# Altium schematic sheet Power Distribution Block.SchDoc: Power Distribution Board
size A4; DocumentNumber: 2; Revision: 1.0; SheetNumber: 2; SheetTotal: 2
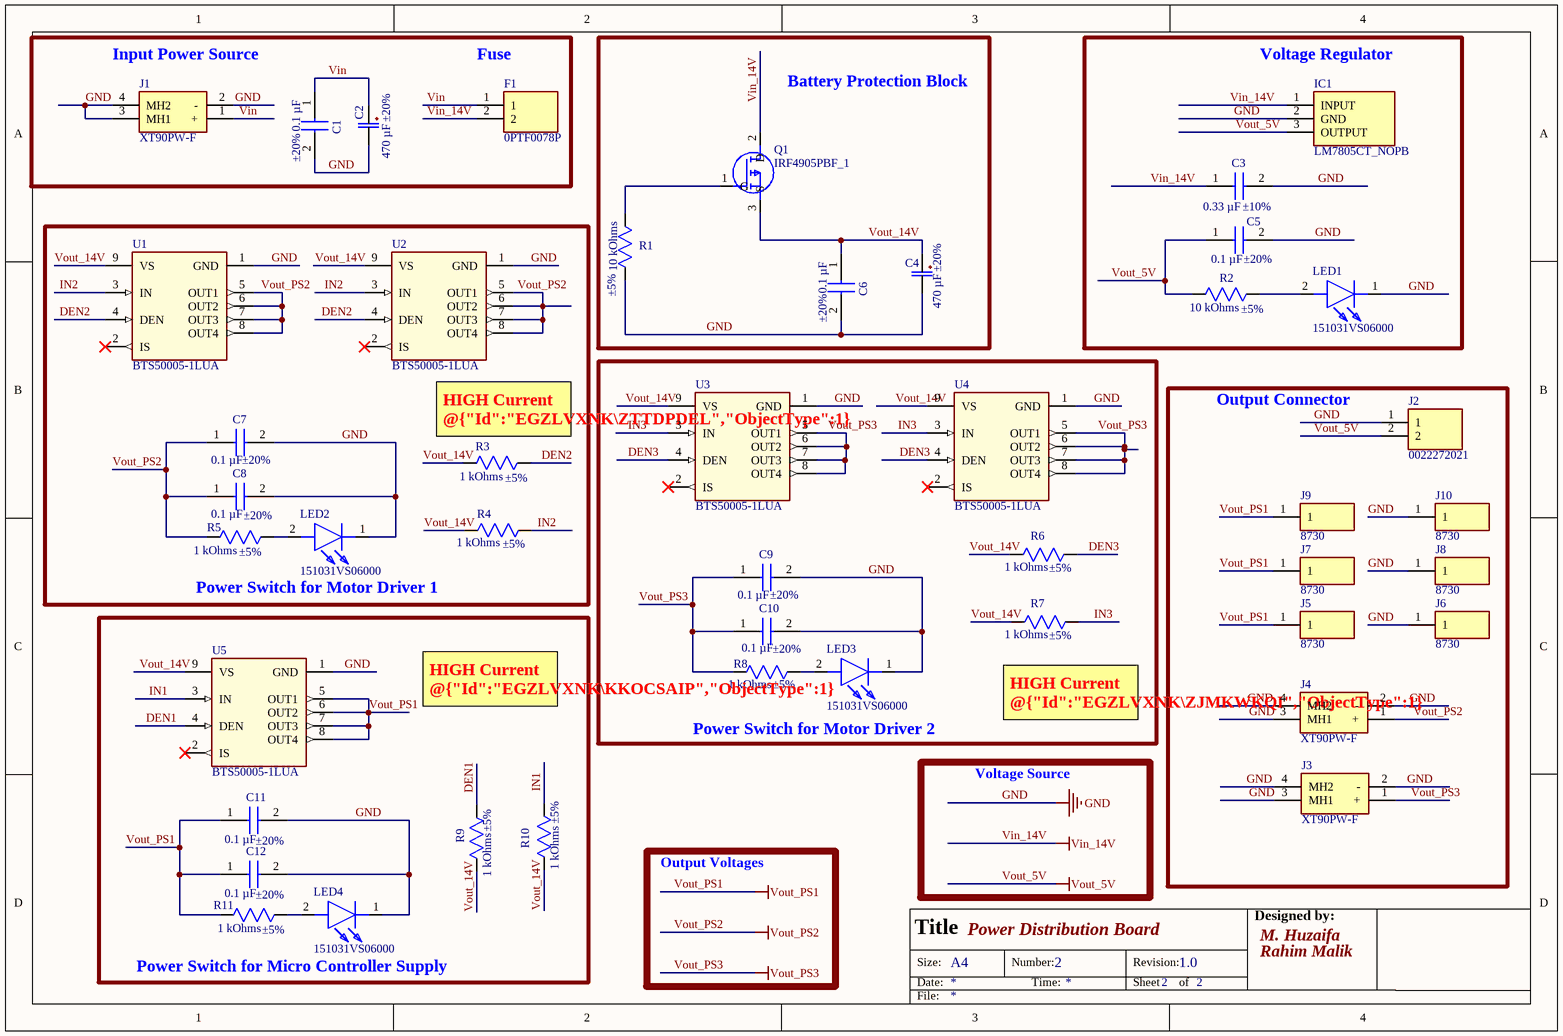
[diagram p0: Power Distribution Block.SchDoc]

## Parts
C1  value 0.1 µF  Tolerance: ±20%  [C322C104K1R5TA]  (hidden comment: C322C104M5U5TA)
C2  value 470 µF  Tolerance: ±20%  [U1-EE_NCH]  (hidden comment: UHE1H471MHD3)
C3  value 0.33 µF  Tolerance: ±10%  [FA24]  (hidden comment: FA24X7R1H334KNU06)
C4  value 470 µF  Tolerance: ±20%  [U1-EE_NCH]  (hidden comment: UHE1H471MHD3)
C5  value 0.1 µF  Tolerance: ±20%  [C322C104K1R5TA]  (hidden comment: C322C104M5U5TA)
C6  value 0.1 µF  Tolerance: ±20%  [C322C104K1R5TA]  (hidden comment: C322C104M5U5TA)
C7  value 0.1 µF  Tolerance: ±20%  [C322C104K1R5TA]  (hidden comment: C322C104M5U5TA)
C8  value 0.1 µF  Tolerance: ±20%  [C322C104K1R5TA]  (hidden comment: C322C104M5U5TA)
C9  value 0.1 µF  Tolerance: ±20%  [C322C104K1R5TA]  (hidden comment: C322C104M5U5TA)
C10  value 0.1 µF  Tolerance: ±20%  [C322C104K1R5TA]  (hidden comment: C322C104M5U5TA)
C11  value 0.1 µF  Tolerance: ±20%  [C322C104K1R5TA]  (hidden comment: C322C104M5U5TA)
C12  value 0.1 µF  Tolerance: ±20%  [C322C104K1R5TA]  (hidden comment: C322C104M5U5TA)
F1  0PTF0078P  [0PTF0078P]
IC1  LM7805CT_NOPB  [TO254P470X1028X1955-3P]
J1  XT90PW-F  [XT90PWM]
J2  0022272021  [SHDR2W64P0X254_1X2_508X580X1170P]
J3  XT90PW-F  [XT90PWF]
J4  XT90PW-F  [XT90PWF]
J5  8730  [8730]
J6  8730  [8730]
J7  8730  [8730]
J8  8730  [8730]
J9  8730  [8730]
J10  8730  [8730]
LED1  151031VS06000  [151034GS03000 - duplicate]
LED2  151031VS06000  [151034GS03000 - duplicate]
LED3  151031VS06000  [151034GS03000 - duplicate]
LED4  151031VS06000  [151034GS03000 - duplicate]
Q1  IRF4905PBF_1  [TO254P469X1042X1967-3P]
R1  value 10 kOhms  Tolerance: ±5%  [STA_CF14_STP]  (hidden comment: CF14JT10K0)
R2  value 10 kOhms  Tolerance: ±5%  [STA_CF14_STP]  (hidden comment: CF14JT10K0)
R3  value 1 kOhms  Tolerance: ±5%  [STA_CF14_STP]  (hidden comment: CF14JT1K00)
R4  value 1 kOhms  Tolerance: ±5%  [STA_CF14_STP]  (hidden comment: CF14JT1K00)
R5  value 1 kOhms  Tolerance: ±5%  [STA_CF14_STP]  (hidden comment: CF14JT1K00)
R6  value 1 kOhms  Tolerance: ±5%  [STA_CF14_STP]  (hidden comment: CF14JT1K00)
R7  value 1 kOhms  Tolerance: ±5%  [STA_CF14_STP]  (hidden comment: CF14JT1K00)
R8  value 1 kOhms  Tolerance: ±5%  [STA_CF14_STP]  (hidden comment: CF14JT1K00)
R9  value 1 kOhms  Tolerance: ±5%  [STA_CF14_STP]  (hidden comment: CF14JT1K00)
R10  value 1 kOhms  Tolerance: ±5%  [STA_CF14_STP]  (hidden comment: CF14JT1K00)
R11  value 1 kOhms  Tolerance: ±5%  [STA_CF14_STP]  (hidden comment: CF14JT1K00)
U1  BTS50005-1LUA  [IFX-PG-HSOF-8-5-6-V -New]
U2  BTS50005-1LUA  [IFX-PG-HSOF-8-5-6-V -New]
U3  BTS50005-1LUA  [IFX-PG-HSOF-8-5-6-V -New]
U4  BTS50005-1LUA  [IFX-PG-HSOF-8-5-6-V -New]
U5  BTS50005-1LUA  [IFX-PG-HSOF-8-5-6-V -New]

## Blocks framed on the sheet
Battery Protection Block: C4 C6 Q1 R1
Voltage Regulator: C3 C5 IC1 LED1 R2
Power Switch for Motor Driver 1: C7 C8 LED2 R3-R5 U1 U2
Power Switch for Motor Driver 2: C9 C10 LED3 R6-R8 U3 U4
Output Connector: J2-J10
Power Switch for Micro Controller Supply: C11 C12 LED4 R9-R11 U5

## Nets
GND: C1.2(-) C2.2 C3.2 C4.2 C5.2(-) C6.2(-) C7.2(-) C8.2(-) C9.2(-) C10.2(-) C11.2(-) C12.2(-) IC1.2(GND) J1.2(-) J1.3(MH1) J1.4(MH2) J2.1 J3.2(-) J3.3(MH1) J3.4(MH2) J4.2(-) J4.3(MH1) J4.4(MH2) J6.1 J8.1 J10.1 LED1.1(K) LED2.1(K) LED3.1(K) LED4.1(K) R1.2 U1.1(GND) U2.1(GND) U3.1(GND) U4.1(GND) U5.1(GND)
Vin_14V: C3.1 F1.2 IC1.1(INPUT) Q1.2(D)
Vout_5V: C5.1(+) IC1.3(OUTPUT) J2.2 R2.2
Vout_PS1: C11.1(+) C12.1(+) J5.1 J7.1 J9.1 R11.2 U5.5(OUT1) U5.6(OUT2) U5.7(OUT3) U5.8(OUT4)
Vout_PS2: C7.1(+) C8.1(+) J4.1(+) R5.2 U1.5(OUT1) U1.6(OUT2) U1.7(OUT3) U1.8(OUT4) U2.5(OUT1) U2.6(OUT2) U2.7(OUT3) U2.8(OUT4)
Vout_PS3: C9.1(+) C10.1(+) J3.1(+) R8.2 U3.5(OUT1) U3.6(OUT2) U3.7(OUT3) U3.8(OUT4) U4.5(OUT1) U4.6(OUT2) U4.7(OUT3) U4.8(OUT4)
DEN1: R9.1 U5.4(DEN)
DEN2: R3.1 U1.4(DEN) U2.4(DEN)
DEN3: R6.1 U3.4(DEN) U4.4(DEN)
IN1: R10.1 U5.3(IN)
IN2: R4.1 U1.3(IN) U2.3(IN)
IN3: R7.1 U3.3(IN) U4.3(IN)
Vin: C1.1(+) C2.1 F1.1 J1.1(+)
Vout_14V: C4.1 C6.1(+) Q1.3(S) R3.2 R4.2 R6.2 R7.2 R9.2 R10.2 U1.9(VS) U2.9(VS) U3.9(VS) U4.9(VS) U5.9(VS)
NetLED1_2: LED1.2(A) R2.1
NetLED2_2: LED2.2(A) R5.1
NetLED3_2: LED3.2(A) R8.1
NetLED4_2: LED4.2(A) R11.1
NetQ1_1: Q1.1(G) R1.1

Not connected (* = marked no-connect by the designer): U1 2(IS)*; U2 2(IS)*; U3 2(IS)*; U4 2(IS)*; U5 2(IS)*

## Notes on the sheet
- (near J1) Input Power Source
- (near F1) Fuse
- HIGH Current @{"Id":"EGZLVXNK\ZTTDPDEL","ObjectType":1}
- HIGH Current @{"Id":"EGZLVXNK\KKOCSAIP","ObjectType":1}
- (near R7) HIGH Current @{"Id":"EGZLVXNK\ZJMKWKQI","ObjectType":1}
- Voltage Source
- Output Voltages
- Designed by:
- Title
- Size:
- Date:
- A4
- Number:
- Time:
- Revision:
- Sheet
- of
- M. Huzaifa
- Rahim Malik
- File:

## Library data of the parts
C1 C5-C12 = C322C104M5U5TA: 0.1 µF ±20% 50V Ceramic Capacitor Z5U Radial; Manufacturer Name: KEMET; Datasheet Link: https://content.kemet.com/datasheets/KEM_C1051_GOLDMAX_Z5U.pdf; Height: 6.6mm; Manufacturer Part Number: C322C104M5U5TA; Supplier: Digikey; Supplier Part Number: 399-4331-ND; Rating: 50V
C2 C4 = UHE1H471MHD3: CAP ALUM 470UF 20% 50V RADIAL TH; Manufacturer Name: Nichicon; Copyright: Copyright (C) 2025 Ultra Librarian. All rights reserved.; Manufacturer Part Number: UHE1H471MHD3; Supplier: Digikey; Supplier Part Number: 493-1615-ND; Rating: 50 V
C3 = FA24X7R1H334KNU06: CAP CER 0.33UF 50V X7R RADIAL; Manufacturer Name: TDK Corporation; Datasheet Link: https://product.tdk.com/system/files/dam/doc/product/capacitor/ceramic/lead-mlcc/catalog/leadmlcc_halogenfree_fa_en.pdf; Height: 7mm; Manufacturer Part Number: FA24X7R1H334KNU06; Supplier Part Number: 445-180638-1-ND; Supplier: Digikey; Rating: 50V
F1 = 0PTF0078P: FUSE BLOCK CARTRIDGE PCB; Manufacturer Name: LITTELFUSE; Datasheet Link: https://media.digikey.com/pdf/Data%20Sheets/Littelfuse%20PDFs/PTF075_77_78.pdf; Height: 11.5mm; Manufacturer Part Number: 0PTF0078P; Supplier Part Number: F6094-ND; Supplier: Digikey
IC1 = LM7805CT_NOPB: IC REG LINEAR 5V 1.5A TO220-3; Manufacturer Name: Texas Instruments; Manufacturer Part Number: LM7805CT/NOPB; Value: 5-35V; Datasheet Link: http://www.ti.com/lit/gpn/lm7800; Height: 4.7mm; Supplier Part Number: 296-47192-ND; Supplier: Digikey; Tolerance: *; Rating: 1.5A
J1 = XT90PW-F: Connector: DC supply; socket; male; XT90; 40A; 500V; PIN: 2; straight; Manufacturer Name: Amass; Manufacturer Part Number: XT90PW-M; Supplier: TEM Electronics Component; Supplier Part Number: XT90PW-M; Value: Male; Tolerance: *; Rating: *
J2 = 0022272021: CONN HEADER VERT 2POS 2.54MM; Manufacturer Name: Molex; Datasheet Link: https://www.molex.com/webdocs/datasheets/pdf/en-us/0022272021_PCB_HEADERS.pdf; Height: 11.7mm; Manufacturer Part Number: 0022272021; Supplier: Digikey; Supplier Part Number: WM4111-ND
J3 J4 = XT90PW-F: Connector: DC supply; socket; female; XT90; 40A; 500V; PIN: 2; THT; Manufacturer Name: Amass; Manufacturer Part Number: XT90PW-F; Supplier: TEM Electronics Component; Supplier Part Number: XT90PW-F; Value: Female; Tolerance: *; Rating: *
J5-J10 = 8730: TERM BINDING POST M2.5 1 PIN PCB; Manufacturer Name: Keystone Electronics; Datasheet Link: https://www.digikey.ph/en/products/detail/keystone-electronics/8730/2170366; Height: 4.88mm; Manufacturer Part Number: 8730; Supplier: 36-8730-ND; Supplier Part Number: Digikey; Value: *; Rating: *; Tolerance: *
LED1-LED4 = 151031VS06000: LED GREEN DIFFUSED 3MM ROUND T/H; Manufacturer Name: Wurth Elektronik; Value: 2.2V; Rating: 20mA; Datasheet Link: https://katalog.we-online.de/led/datasheet/151031VS06000.pdf; Manufacturer Part Number: 151031VS06000; Supplier: Digikey; Supplier Part Number: 732-5008-ND; Tolerance: *
Q1 = IRF4905PBF_1: MOSFET P-CH 55V 74A TO220AB; Manufacturer Name: Infineon; Datasheet Link: https://datasheet.datasheetarchive.com/originals/distributors/Datasheets_SAMA/e52aa5f51fe2980ce3912b85b4d53dd4.pdf; Height: 4.69mm; Manufacturer Part Number: IRF4905PBF; Supplier: Digikey; Supplier Part Number: IRF4905PBF-ND; Rating: 74A
R1 R2 = CF14JT10K0: RES 10K OHM 5% 1/4W AXIAL; Manufacturer Name: Stackpole Electronics Inc; Rating: 0.25W,1/4W; Manufacturer Part Number: CF14JT10K0; Supplier: Digikey; Supplier Part Number: CF14JT10K0TR-ND
R3-R11 = CF14JT1K00: RES 1K OHM 5% 1/4W AXIAL; Manufacturer Name: Stackpole Electronics Inc; Rating: 0.25W, 1/4W; Manufacturer Part Number: CF14JT1K00; Supplier: Digikey; Supplier Part Number: CF14JT1K00TR-ND
U1-U5 = BTS50005-1LUA: Smart High-Side Power Switch; Manufacturer Part Number: BTS500051LUAAUMA1; Manufacturer Name: Infineon Technologies; Value: 3.1V ~ 28V; Rating: 65A; Supplier: Digikey; Supplier Part Number: 448-BTS500051LUAAUMA1TR-ND; Tolerance: *